# Altium schematic sheet PowerDist.SchDoc
size Letter; SheetNumber: 4; SheetTotal: 15
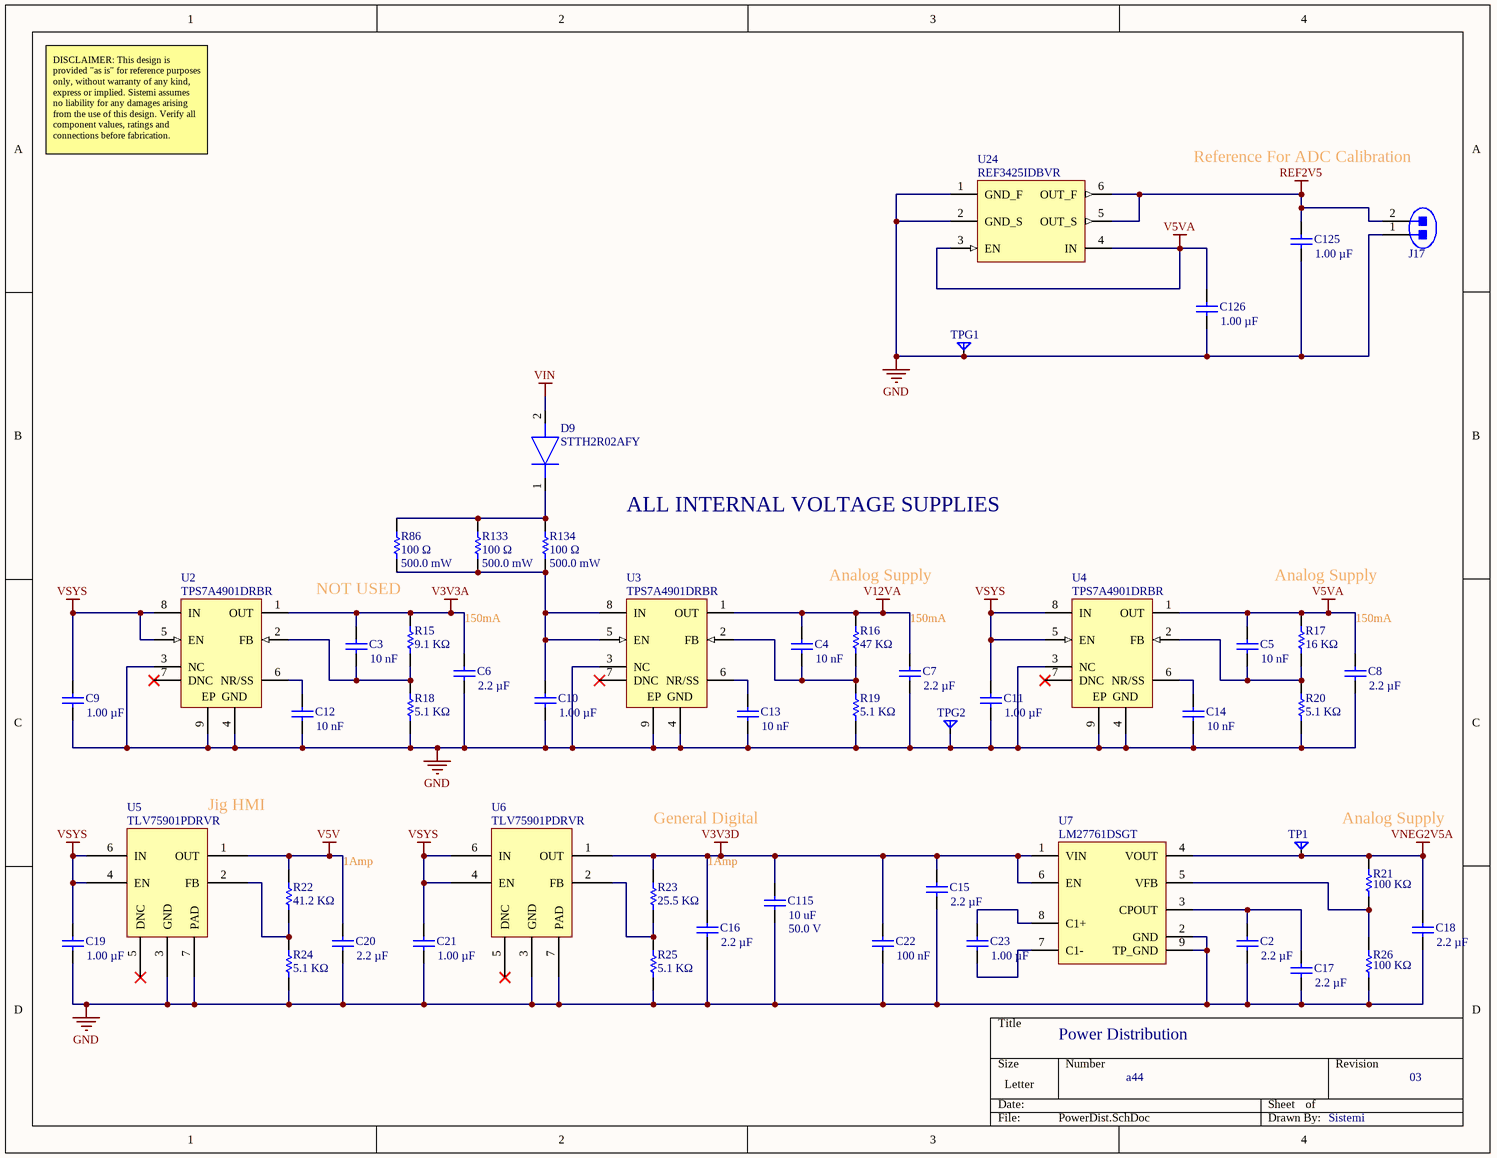
[diagram p0: PowerDist.SchDoc]

## Parts
C2  Capacitance: 2.2 µF  [CAPC1608X90X35NL15T15]  (hidden comment: 2.2 µF,±10%,25V,X7R,0603)
C3  Capacitance: 10 nF  [CAPC1005X56X25NL10T15]  (hidden comment: 10 nF,±10%,25V,CGO,0402)
C4  Capacitance: 10 nF  [CAPC1005X56X25NL10T15]  (hidden comment: 10 nF,±10%,25V,CGO,0402)
C5  Capacitance: 10 nF  [CAPC1005X56X25NL10T15]  (hidden comment: 10 nF,±10%,25V,CGO,0402)
C6  Capacitance: 2.2 µF  [CAPC1608X90X35NL15T15]  (hidden comment: 2.2 µF,±10%,25V,X7R,0603)
C7  Capacitance: 2.2 µF  [CAPC1608X90X35NL15T15]  (hidden comment: 2.2 µF,±10%,25V,X7R,0603)
C8  Capacitance: 2.2 µF  [CAPC1608X90X35NL15T15]  (hidden comment: 2.2 µF,±10%,25V,X7R,0603)
C9  Capacitance: 1.00 µF  [CAPC1608X90X35NL15T15]  (hidden comment: Samsung CL10B105KA8NNNC)
C10  Capacitance: 1.00 µF  [CAPC1608X90X35NL15T15]  (hidden comment: Samsung CL10B105KA8NNNC)
C11  Capacitance: 1.00 µF  [CAPC1608X90X35NL15T15]  (hidden comment: Samsung CL10B105KA8NNNC)
C12  Capacitance: 10 nF  [CAPC1005X56X25NL10T15]  (hidden comment: 10 nF,±10%,25V,CGO,0402)
C13  Capacitance: 10 nF  [CAPC1005X56X25NL10T15]  (hidden comment: 10 nF,±10%,25V,CGO,0402)
C14  Capacitance: 10 nF  [CAPC1005X56X25NL10T15]  (hidden comment: 10 nF,±10%,25V,CGO,0402)
C15  Capacitance: 2.2 µF  [CAPC1608X90X35NL15T15]  (hidden comment: 2.2 µF,±10%,25V,X7R,0603)
C16  Capacitance: 2.2 µF  [CAPC1608X90X35NL15T15]  (hidden comment: 2.2 µF,±10%,25V,X7R,0603)
C17  Capacitance: 2.2 µF  [CAPC1608X90X35NL15T15]  (hidden comment: 2.2 µF,±10%,25V,X7R,0603)
C18  Capacitance: 2.2 µF  [CAPC1608X90X35NL15T15]  (hidden comment: 2.2 µF,±10%,25V,X7R,0603)
C19  Capacitance: 1.00 µF  [CAPC1608X90X35NL15T15]  (hidden comment: Samsung CL10B105KA8NNNC)
C20  Capacitance: 2.2 µF  [CAPC1608X90X35NL15T15]  (hidden comment: 2.2 µF,±10%,25V,X7R,0603)
C21  Capacitance: 1.00 µF  [CAPC1608X90X35NL15T15]  (hidden comment: Samsung CL10B105KA8NNNC)
C22  Capacitance: 100 nF  [CAPC1005X56X25NL10T15]  (hidden comment: Samsung CL05B104KO5NNNC)
C23  Capacitance: 1.00 µF  [CAPC1608X90X35NL15T15]  (hidden comment: Samsung CL10B105KA8NNNC)
C115  Capacitance: 10 uF  Voltage Rating (DC): 50.0 V  [CAPC3216X180X55LL20T25]  (hidden comment: Murata GRM31CR61H106KA12L)
C125  Capacitance: 1.00 µF  [CAPC1608X90X35NL15T15]  (hidden comment: Samsung CL10B105KA8NNNC)
C126  Capacitance: 1.00 µF  [CAPC1608X90X35NL15T15]  (hidden comment: Samsung CL10B105KA8NNNC)
D9  STTH2R02AFY  [SODFL4724X103N]
J17  TE Connectivity / AMP 5-146280-2  [PCB-nx47vqovjjduu8dkc1uz-1]  (value not drawn)
R15  Resistance: 9.1 KΩ  [RESC1608X55X30ML15T15]  (hidden comment: Generic RES 0603)
R16  Resistance: 47 KΩ  [RESC1608X55X30LL15T15]  (hidden comment: Generic RES 0603)
R17  Resistance: 16 KΩ  [RESC1608X55X30ML15T15]  (hidden comment: Generic RES 0603)
R18  Resistance: 5.1 KΩ  [RESC1608X55X30ML15T15]  (hidden comment: Generic RES 0603)
R19  Resistance: 5.1 KΩ  [RESC1608X55X30LL15T15]  (hidden comment: Generic RES 0603)
R20  Resistance: 5.1 KΩ  [RESC1608X55X30ML15T15]  (hidden comment: Generic RES 0603)
R21  Resistance: 100 KΩ  [RESC1005X40X25NL05T05]  (hidden comment: 100 KΩ,±1%,0402)
R22  Resistance: 41.2 KΩ  [RESC1608X55X30LL15T15]  (hidden comment: Generic RES 0603)
R23  Resistance: 25.5 KΩ  [RESC1608X55X30ML15T15]  (hidden comment: Generic RES 0603)
R24  Resistance: 5.1 KΩ  [RESC1608X55X30LL15T15]  (hidden comment: Generic RES 0603)
R25  Resistance: 5.1 KΩ  [RESC1608X55X30ML15T15]  (hidden comment: Generic RES 0603)
R26  Resistance: 100 KΩ  [RESC1005X40X25NL05T05]  (hidden comment: 100 KΩ,±1%,0402)
R86  Power Rating: 500.0 mW  Resistance: 100 Ω  [RESC1608X55X30ML15T15]  (hidden comment: Generic RES 0603)
R133  Power Rating: 500.0 mW  Resistance: 100 Ω  [RESC1608X55X30ML15T15]  (hidden comment: Generic RES 0603)
R134  Power Rating: 500.0 mW  Resistance: 100 Ω  [RESC1608X55X30ML15T15]  (hidden comment: Generic RES 0603)
TP1  Test Point Pad  [PCB-w5299rxaittb4m04ntfs-1]  (value not drawn)
TPG1  Test Point Pad  [PCB-w5299rxaittb4m04ntfs-1]  (value not drawn)
TPG2  Test Point Pad  [PCB-w5299rxaittb4m04ntfs-1]  (value not drawn)
U2  TPS7A4901DRBR  [TI-DRB8-1750X1500TP_V]
U3  TPS7A4901DRBR  [TI-DRB8-1750X1500TP_V]
U4  TPS7A4901DRBR  [TI-DRB8-1750X1500TP_V]
U5  TLV75901PDRVR  [PCB-ude52gq66msu1251nhm5-1]
U6  TLV75901PDRVR  [PCB-ude52gq66msu1251nhm5-1]
U7  LM27761DSGT  [PCB-4n89rivuw3spi8alca02-1]
U24  REF3425IDBVR  [PCB-iii9p4hirjo0din0ylk5-1]

## Nets
GND: C2.1 C6.1 C7.1 C8.1 C9.1 C10.1 C11.1 C12.1 C13.1 C14.1 C15.1 C16.1 C17.1 C18.1 C19.1 C20.1 C21.1 C22.1 C115.1 C125.1 C126.1 J17.1 R18.1 R19.1 R20.1 R24.1 R25.1 R26.1 TPG1.1(A) TPG2.1(A) U2.3(NC) U2.4(GND) U2.9(EP) U3.3(NC) U3.4(GND) U3.9(EP) U4.3(NC) U4.4(GND) U4.9(EP) U5.3(GND) U5.7(PAD) U6.3(GND) U6.7(PAD) U7.2(GND) U7.9(TP_GND) U24.1(GND_F) U24.2(GND_S)
REF2V5: C125.2 J17.2 U24.5(OUT_S) U24.6(OUT_F)
V3V3A: C3.2 C6.2 R15.2 U2.1(OUT)
V3V3D: C15.2 C16.2 C22.2 C115.2 R23.2 U6.1(OUT) U7.1(VIN) U7.6(EN)
V5V: C20.2 R22.2 U5.1(OUT)
V5VA: C5.2 C8.2 C126.2 R17.2 U4.1(OUT) U24.3(EN) U24.4(IN)
V12VA: C4.2 C7.2 R16.2 U3.1(OUT)
VIN: D9.2(A)
VNEG2V5A: C18.2 R21.2 TP1.1(A) U7.4(VOUT)
VSYS: C9.2 C11.2 C19.2 C21.2 U2.5(EN) U2.8(IN) U4.5(EN) U4.8(IN) U5.4(EN) U5.6(IN) U6.4(EN) U6.6(IN)
NetC2_2: C2.2 C17.2 U7.3(CPOUT)
NetC3_1: C3.1 R15.1 R18.2 U2.2(FB)
NetC4_1: C4.1 R16.1 R19.2 U3.2(FB)
NetC5_1: C5.1 R17.1 R20.2 U4.2(FB)
NetC10_2: C10.2 R86.1 R133.1 R134.1 U3.5(EN) U3.8(IN)
NetC12_2: C12.2 U2.6(NR/SS)
NetC13_2: C13.2 U3.6(NR/SS)
NetC14_2: C14.2 U4.6(NR/SS)
NetC23_1: C23.1 U7.7(C1-)
NetC23_2: C23.2 U7.8(C1+)
NetD9_1: D9.1(K) R86.2 R133.2 R134.2
NetR21_1: R21.1 R26.2 U7.5(VFB)
NetR22_1: R22.1 R24.2 U5.2(FB)
NetR23_1: R23.1 R25.2 U6.2(FB)

Not connected (* = marked no-connect by the designer): U2 7(DNC)*; U3 7(DNC)*; U4 7(DNC)*; U5 5(DNC)*; U6 5(DNC)*

## Notes on the sheet
- DISCLAIMER: This design is provided "as is" for reference purposes only, without warranty of any kind, express or implied. Sistemi assumes no liability for any damages arising from the use of this design. Verify all component values, ratings and connections before fabrication.
- Reference For ADC Calibration
- ALL INTERNAL VOLTAGE SUPPLIES
- NOT USED
- 150mA
- Analog Supply
- (near U5) Jig HMI
- General Digital
- 1Amp
- Power Distribution
- a44
- 03
- Sistemi

## Library data of the parts
C2 C6-C8 C15-C18 C20 = CMP-7473528-7: Generic CAP 0603, =Capacitance+','+Tolerance+','+Voltage+','+Dielectric; Manufacturer Part Number: GRM188Z71E225KE43D; Lead-Free Status: Lead Free; RoHS: Compliant; Voltage: 25V; Footprint: PCB-0002-00062-3; Dielectric: X7R; Tolerance: ±10%; OctopartID: ce7a065e703111bd; Mounting Style: Surface Mount; Octopart URL: TBD; Case: 0603
C3-C5 C12-C14 = CMP-bf2276a55d9a60e5-20: Generic CAP 0402, =Capacitance+','+Tolerance+','+Voltage+','+Dielectric+','+Case; Manufacturer Part Number: GRM1555C1E103JE01J; Lead-Free Status: Lead Free; Octopart URL: TBD; Case: 0402; OctopartID: 0755ced2c795d892; Voltage: 25V; Dielectric: CGO; RoHS: Compliant; Mounting Style: Surface Mount; Tolerance: ±10%; Footprint: PCB-0002-00476-3
C9-C11 C19 C21 C23 C125 C126 = CMP-7473528-5: CL Series 0603 1 uF 25 V ±10 % X7R Surface Mount Multilayer Ceramic Capacitor; Manufacturer Part Number: UMK107AB7105KA-T; Lead-Free Status: Lead Free; Capacitance Tolerance: ±10%; Voltage Rating (DC): 25.0 V; RoHS: Compliant; Mounting Style: Surface Mount; Footprint: PCB-0002-00062-3; Octopart URL: http://octopart.com/cl10b105ka8nnnc-samsung-19831597; Case/Package: 0603; OctopartID: ce7a065e703111bd; Dielectric Characteristic: X7R
C22 = CMP-bf2276a55d9a60e5-19: Ceramic capacitor SMD-0402 100nF /16V X7R# K +-10%, Samsung, RoHS; Dielectric Characteristic: X7R; Lead-Free Status: Lead Free; Voltage Rating (DC): 16.0 V; Capacitance Tolerance: ±10%; Mounting Style: Surface Mount; Case/Package: 0402; OctopartID: 0755ced2c795d892; Footprint: PCB-0002-00476-3; Octopart URL: https://octopart.com/cl05b104ko5nnnc-samsung-9299366; RoHS: Compliant; Manufacturer Part Number: CL05B104KO5NNNC
C115 = CMP-3554908-2: Multilayer Ceramic Capacitors MLCC - SMD/SMT 1206 10uF 50volt X5R +/-10%; Manufacturer Part Number: CL31B106KBHNNNE; Capacitance Tolerance: ±10%; Case/Package (SI): 3216; Lead-Free Status: Lead Free; Dielectric Characteristic: X5R; Lifecycle Status: Active; Mounting Style: Surface Mount; Number of Pins: 2; Octopart Url: https://octopart.com/grm31cr61h106ka12l-murata-18903335; OctopartID: fd8535afa9c42242; Packaging: Cut Tape (CT); REACH SVHC Compliance: No SVHC; RoHS: Compliant; Size-Length: 0.0032 m; Size-Thickness: 0.0016 m; Size-Width: 0.0016 m
D9 = STTH2R02AFY: Diode; Manufacturer_Name: STMicroelectronics; Datasheet Link: https://www.st.com/resource/en/datasheet/stth2r02af-y.pdf; Height: 1.03mm; Manufacturer Part Number: STTH2R02AFY; Mouser Part Number: 511-STTH2R02AFY; Mouser Price/Stock: https://www.mouser.co.uk/ProductDetail/STMicroelectronics/STTH2R02AFY?qs=pZIKbki37pqpUMRfOtxSog%3D%3D; Arrow Part Number: STTH2R02AFY; Arrow Price/Stock: https://www.arrow.com/en/products/stth2r02afy/stmicroelectronics
J17 = CMP-876e4e6699ef58a9-5: 2 Positions Header, Unshrouded, Breakaway Connector 0.100" (2.54mm) Through Hole Gold; Vendor Part Number: A121480-ND; Manufacturer: TE Connectivity AMP Connectors; Vendor: Digikey; Number of Positions: 2; Contact Type: Male Pin; Octopart URL: http://octopart.com/5-146280-2-te+connectivity+%2F+amp-39436426; Contact Finish: Gold; HelpURL: http://www.te.com/commerce/DocumentDelivery/DDEController?Action=srchrtrv&DocNm=146280&DocType=Customer+Drawing&DocLang=English; Cost: 0.43; Contact Mating Length: 0.230" (5.84mm); Mounting Type: Through Hole; Family: Rectangular Connectors - Headers, Male Pins; Connector Type: Header, Unshrouded, Breakaway; Category: Connectors, Interconnects; Number of Rows: 1; Pitch: Header, Unshrouded, Breakaway; Manufacturer Part Number: 5-146280-2; Contact Finish Thickness: 15µin (0.38µm); OctopartID: 3545fe16d0a9ea82
R15 = CMP-0800c38b3cf2d7c7-3: Generic RES 0603, =Resistance+','+Tolerance+','+Case; Manufacturer Part Number: RT0603FRE079K1L; Case/Package (SI): 1608; Lead-Free Status: Lead Free; Power Rating: 63.0 mW; Voltage: 50V; ELV Compliant: Compliant; Tolerance: ±1%; Temperature Coefficient: -50.0 ppm/°C to 50.0 ppm/°C; Octopart URL: TBD; Number of Pins: 2; Mounting Style: Surface Mount; Packaging: Tape & Reel (TR); Lifecycle Status: Active; RoHS: Compliant; Case: 0603; Operating Temperature: -55.0 °C to 125 °C; REACH SVHC Compliance: No SVHC; Footprint: PCB-0002-00066-3; OctopartID: a8e96364fc37772e
R16 = CMP-0800c38b3cf2d7c7-3: Generic RES 0603, =Resistance+','+Tolerance+','+Case; Manufacturer Part Number: RT0603FRE1347KL; Case/Package (SI): 1608; Lead-Free Status: Lead Free; Power Rating: 63.0 mW; Voltage: 50V; ELV Compliant: Compliant; Tolerance: ±1%; Temperature Coefficient: -50.0 ppm/°C to 50.0 ppm/°C; Octopart URL: TBD; Number of Pins: 2; Mounting Style: Surface Mount; Packaging: Tape & Reel (TR); Lifecycle Status: Active; RoHS: Compliant; Case: 0603; Operating Temperature: -55.0 °C to 125 °C; REACH SVHC Compliance: No SVHC; Footprint: PCB-0002-00066-3; OctopartID: a8e96364fc37772e
R17 = CMP-0800c38b3cf2d7c7-3: Generic RES 0603, =Resistance+','+Tolerance+','+Case; Manufacturer Part Number: MCT06030C1602FP500; Case/Package (SI): 1608; Lead-Free Status: Lead Free; Power Rating: 63.0 mW; Voltage: 50V; ELV Compliant: Compliant; Tolerance: ±1%; Temperature Coefficient: -50.0 ppm/°C to 50.0 ppm/°C; Octopart URL: TBD; Number of Pins: 2; Mounting Style: Surface Mount; Packaging: Tape & Reel (TR); Lifecycle Status: Active; RoHS: Compliant; Case: 0603; Operating Temperature: -55.0 °C to 125 °C; REACH SVHC Compliance: No SVHC; Footprint: PCB-0002-00066-3; OctopartID: a8e96364fc37772e
R18-R20 R24 R25 = CMP-0800c38b3cf2d7c7-3: Generic RES 0603, =Resistance+','+Tolerance+','+Case; Manufacturer Part Number: RT0603FRE075K1L; Case/Package (SI): 1608; Lead-Free Status: Lead Free; Power Rating: 63.0 mW; Voltage: 50V; ELV Compliant: Compliant; Tolerance: ±1%; Temperature Coefficient: -50.0 ppm/°C to 50.0 ppm/°C; Octopart URL: TBD; Number of Pins: 2; Mounting Style: Surface Mount; Packaging: Tape & Reel (TR); Lifecycle Status: Active; RoHS: Compliant; Case: 0603; Operating Temperature: -55.0 °C to 125 °C; REACH SVHC Compliance: No SVHC; Footprint: PCB-0002-00066-3; OctopartID: a8e96364fc37772e
R21 R26 = CMP-3902036-3: Generic RES 0402, =Resistance+','+Tolerance+','+Case; Manufacturer Part Number: RT0402FRE07100KL; Lead-Free Status: Lead Free; Voltage: 50.0 V; Power: 0.063 W; Mounting Style: Surface Mount; RoHS: Compliant; Number of Pins: 2; Tolerance: ±1%; Octopart Url: TBD; Case: 0402; OctopartID: 26dced8948c2f91b
R22 = CMP-0800c38b3cf2d7c7-3: Generic RES 0603, =Resistance+','+Tolerance+','+Case; Manufacturer Part Number: RT0603BRE0741K2L; Case/Package (SI): 1608; Lead-Free Status: Lead Free; Power Rating: 63.0 mW; Voltage: 50V; ELV Compliant: Compliant; Tolerance: ±1%; Temperature Coefficient: -50.0 ppm/°C to 50.0 ppm/°C; Octopart URL: TBD; Number of Pins: 2; Mounting Style: Surface Mount; Packaging: Tape & Reel (TR); Lifecycle Status: Active; RoHS: Compliant; Case: 0603; Operating Temperature: -55.0 °C to 125 °C; REACH SVHC Compliance: No SVHC; Footprint: PCB-0002-00066-3; OctopartID: a8e96364fc37772e
R23 = CMP-0800c38b3cf2d7c7-3: Generic RES 0603, =Resistance+','+Tolerance+','+Case; Manufacturer Part Number: RT0603FRE0725K5L; Case/Package (SI): 1608; Lead-Free Status: Lead Free; Power Rating: 63.0 mW; Voltage: 50V; ELV Compliant: Compliant; Tolerance: ±1%; Temperature Coefficient: -50.0 ppm/°C to 50.0 ppm/°C; Octopart URL: TBD; Number of Pins: 2; Mounting Style: Surface Mount; Packaging: Tape & Reel (TR); Lifecycle Status: Active; RoHS: Compliant; Case: 0603; Operating Temperature: -55.0 °C to 125 °C; REACH SVHC Compliance: No SVHC; Footprint: PCB-0002-00066-3; OctopartID: a8e96364fc37772e
R86 R133 R134 = CMP-0800c38b3cf2d7c7-3: Generic RES 0603, =Resistance+','+Tolerance+','+Case; Manufacturer Part Number: SG73S1JTTD101J; Case/Package (SI): 1608; Lead-Free Status: Lead Free; Voltage: 50V; ELV Compliant: Compliant; Tolerance: ±1%; Temperature Coefficient: -50.0 ppm/°C to 50.0 ppm/°C; Octopart URL: TBD; Number of Pins: 2; Mounting Style: Surface Mount; Packaging: Tape & Reel (TR); Lifecycle Status: Active; RoHS: Compliant; Case: 0603; Operating Temperature: -55.0 °C to 125 °C; REACH SVHC Compliance: No SVHC; Footprint: PCB-0002-00066-3; OctopartID: a8e96364fc37772e
TP1 TPG1 TPG2 = CMP-lokszv1vctu4w47553pe-6: Test Point
U2-U4 = CMP-6782ad9879f0b845-2: IC REG LDO ADJ 0.15A 8SON / LDO Regulator Pos 1.194V to 33V 0.15A 8-Pin VSON EP T/R; Number of Regulated Outputs: 1; Quiescent Current: 800.0 µA; Dropout Voltage: 300 mV; Output Capacitor Type: Ceramic; Lead-Free Status: RoHS & Green; RoHS: Compliant; Manufacturer Part Number: TPS7A4901DRBR; Packaging: Tape & Reel (TR); Octopart Url: https://octopart.com/tps7a4901drbr-texas+instruments-51395348; Number of Pins: 8; Operating Temperature: -40.0 °C to 125 °C; OctopartID: 6782ad9879f0b845; Lifecycle Status: Pre-Release; Mounting Style: Surface Mount
U5 U6 = CMP-2b7ce7b2db7ff4bb-4: LDO Regulator Pos 0.55V to 5.5V 1A 6-Pin WSON EP T/R; Dropout Voltage: 190 mV; Number of Regulated Outputs: 1; Output Capacitor Type: Ceramic; Quiescent Current: 25.0 µA; OctopartID: 2b7ce7b2db7ff4bb; Manufacturer Part Number: TLV75901PDRVR; Footprint: PCB-6kp9dl1mk9yrlugndkjx-1; RoHS: Compliant; Octopart URL: https://octopart.com/tlv75901pdrvr-texas+instruments-96785765; Number of Pins: 6; Lifecycle Status: Pre-Release; Case/Package: WSON; Operating Temperature: -40.0 °C to 125 °C
U7 = CMP-6c42a6b0b832b385-2: Low-Noise regulated Switched Capacitor Voltage Inverter 8-WSON -40 to 85; Quiescent Current: 370 µA; Lead-Free Status: Lead Free; Output Voltage: -5.00 V (min); Number of Regulated Outputs: 1; Output Current: 250 mA; RoHS: Compliant; Mounting Style: Surface Mount; Number of Pins: 8; Manufacturer Part Number: LM27761DSGT; Octopart URL: http://octopart.com/lm27761dsgt-texas+instruments-66646294; Packaging: Cut Tape (CT); Lifecycle Status: Active; Footprint: PCB-j228smfc5dpw7all0w6z-1; OctopartID: 6c42a6b0b832b385; Case/Package: WSON
U24 = CMP-450589207bdc9ac2-1: 2.5-V low-drift low-power small-footprint series voltage reference 6-SOT-23 -40 to 125; Temperature Coefficient: 2.50 ppm/°C; Quiescent Current: 72.0 µA; Packaging: Cut Tape (CT); Octopart URL: https://octopart.com/ref3425idbvr-texas+instruments-86973375; RoHS: Compliant; Lifecycle Status: Pre-Release; Case/Package: SOT-23; OctopartID: 450589207bdc9ac2; Number of Pins: 6; Manufacturer Part Number: REF3425IDBVR; Operating Temperature: -40.0 °C (min)